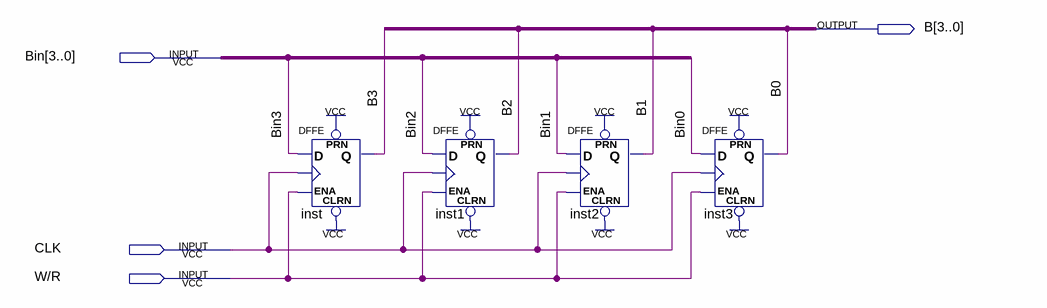
[diagram p0: schematic sheet]
// Quartus schematic registro-B.bdf as structural Verilog: 4 symbols, 4 pins
module \registro-B  (
  input  [3:0] Bin,
  input  CLK,
  input  \W/R ,
  output [3:0] B
);

  DFFE inst (.PRN(1'b1), .CLRN(1'b1), .D(Bin[3]), .CLK(CLK), .ENA(\W/R ), .Q(B[3]));
  DFFE inst1 (.PRN(1'b1), .CLRN(1'b1), .D(Bin[2]), .CLK(CLK), .ENA(\W/R ), .Q(B[2]));
  DFFE inst2 (.PRN(1'b1), .CLRN(1'b1), .D(Bin[1]), .CLK(CLK), .ENA(\W/R ), .Q(B[1]));
  DFFE inst3 (.PRN(1'b1), .CLRN(1'b1), .D(Bin[0]), .CLK(CLK), .ENA(\W/R ), .Q(B[0]));
endmodule
